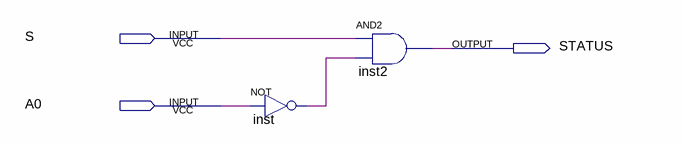
[diagram p0: schematic sheet]
// Quartus schematic BLOCO_par.bdf as structural Verilog: 2 symbols, 3 pins
module BLOCO_par (
  input  S,
  input  A0,
  output STATUS
);

  wire inst_out;

  not inst (inst_out, A0);
  and inst2 (STATUS, S, inst_out);
endmodule
